# EAGLE design Belajar Eagle (EAGLE 9.6.1)
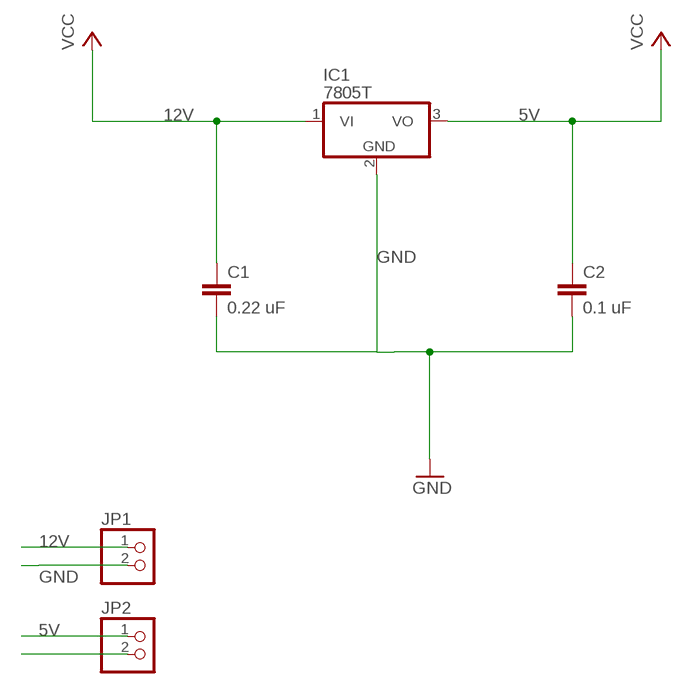
[diagram p0: schematic, sheet 1]

## Parts
C1  0.22 uF  C-EU050-075X075  [C050-075X075]
C2  0.1 uF  C-EU050-075X075  [C050-075X075]
IC1  7805T  [TO220H]
JP1  PINHD-1X2  [1X02]
JP2  PINHD-1X2  [1X02]

## Nets
5V: C2.1 IC1.3(VO) JP2.1 ; supply symbol labelled VCC
12V: C1.1 IC1.1(VI) JP1.1 ; supply symbol labelled VCC
GND: C1.2 C2.2 IC1.2(GND) JP1.2 JP2.2

## Library data of the parts
C1 C2 = rcl:C-EU: CAPACITOR, European symbol; SPICEPREFIX: C
IC1 = linear:78*: Positive VOLTAGE REGULATOR Source: http://cache.national.com/ds/LM/LM78L05.pdf http://www.fairchildsemi.com/ds/LM/LM7805.pdf
JP1 JP2 = pinhead:PINHD-1X2: PIN HEADER

## Board
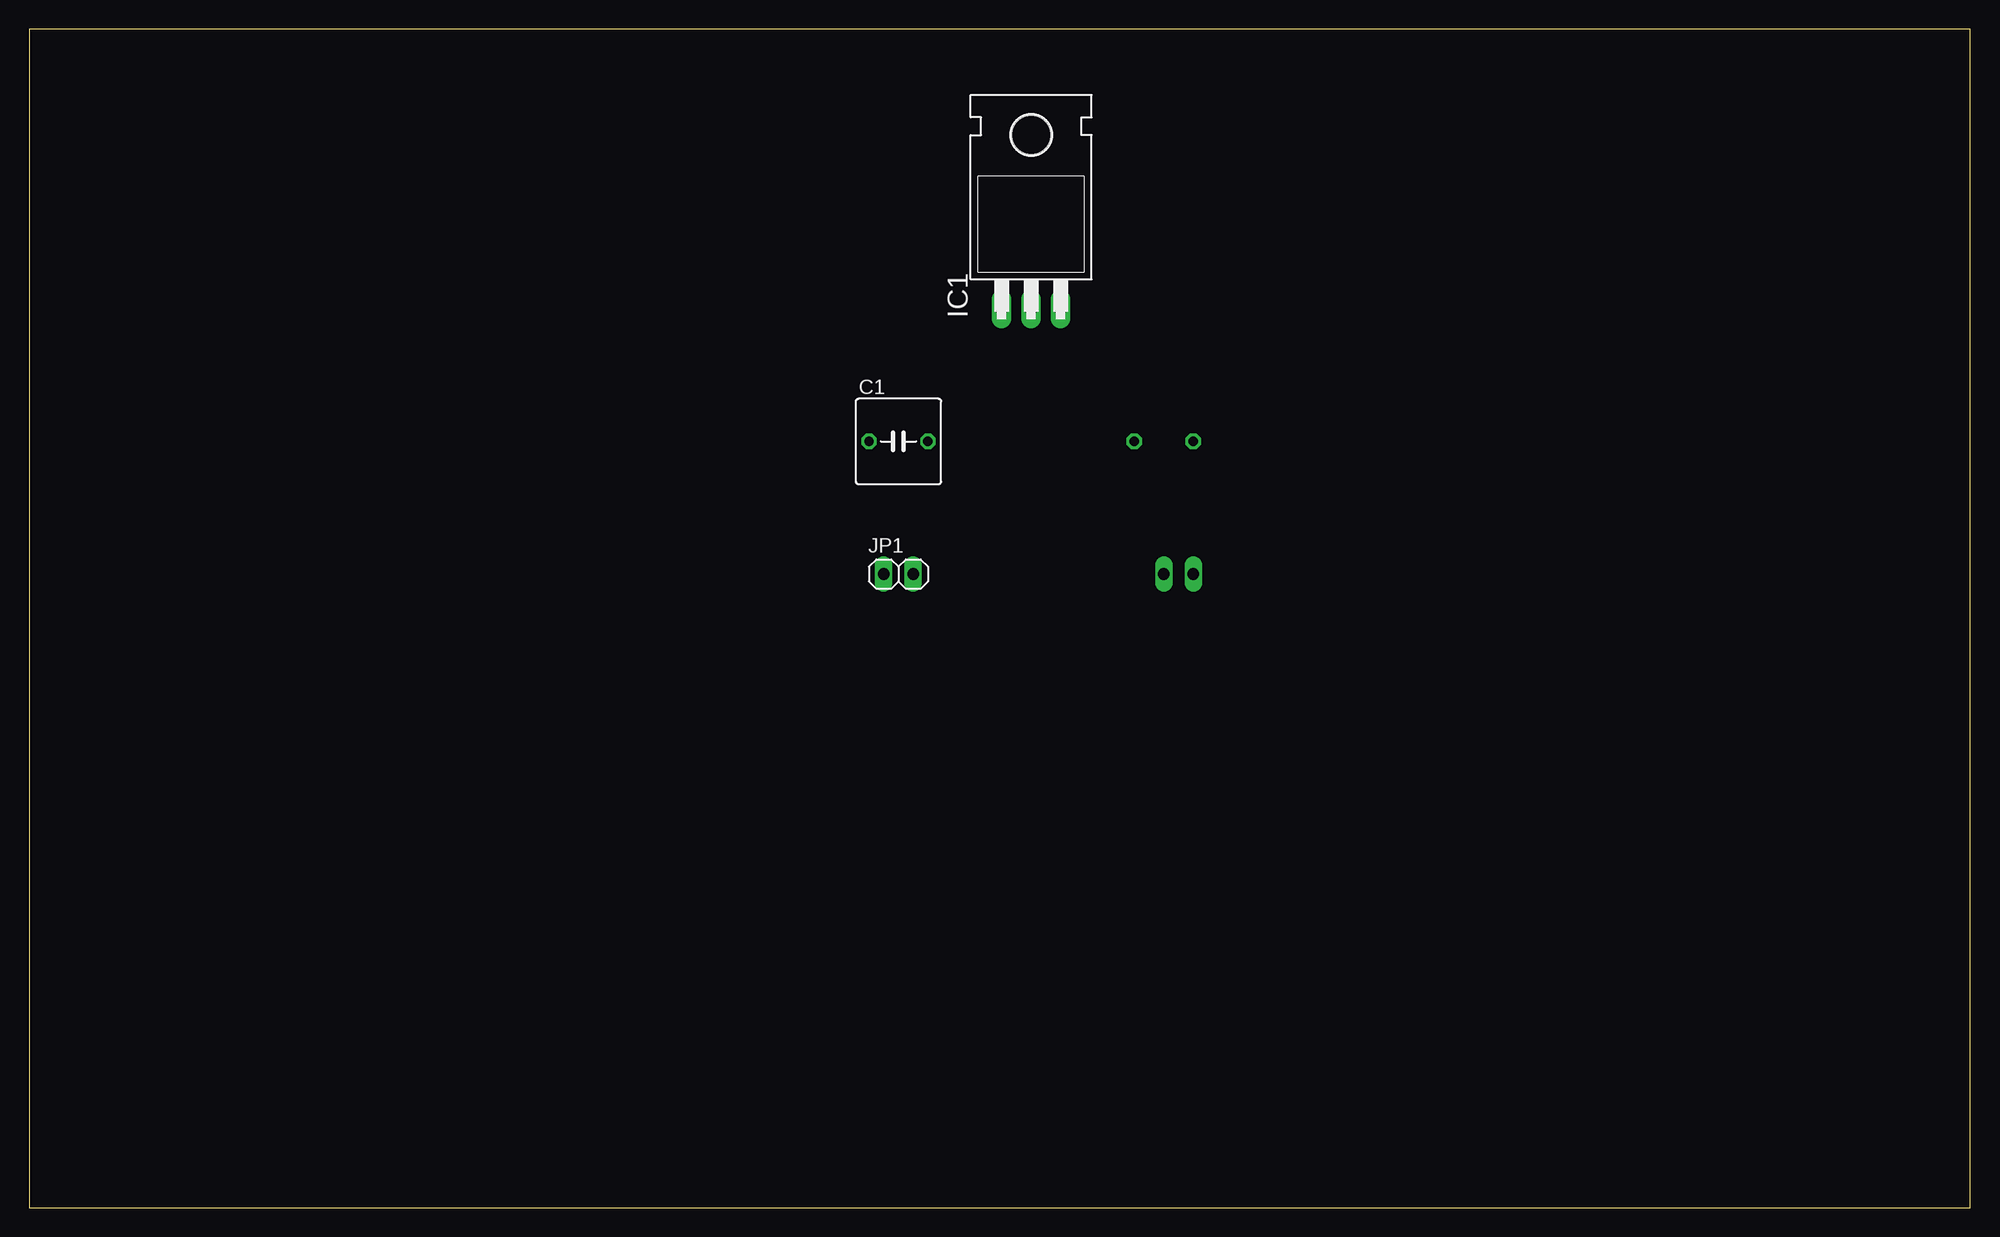
[diagram p1: board, top side]
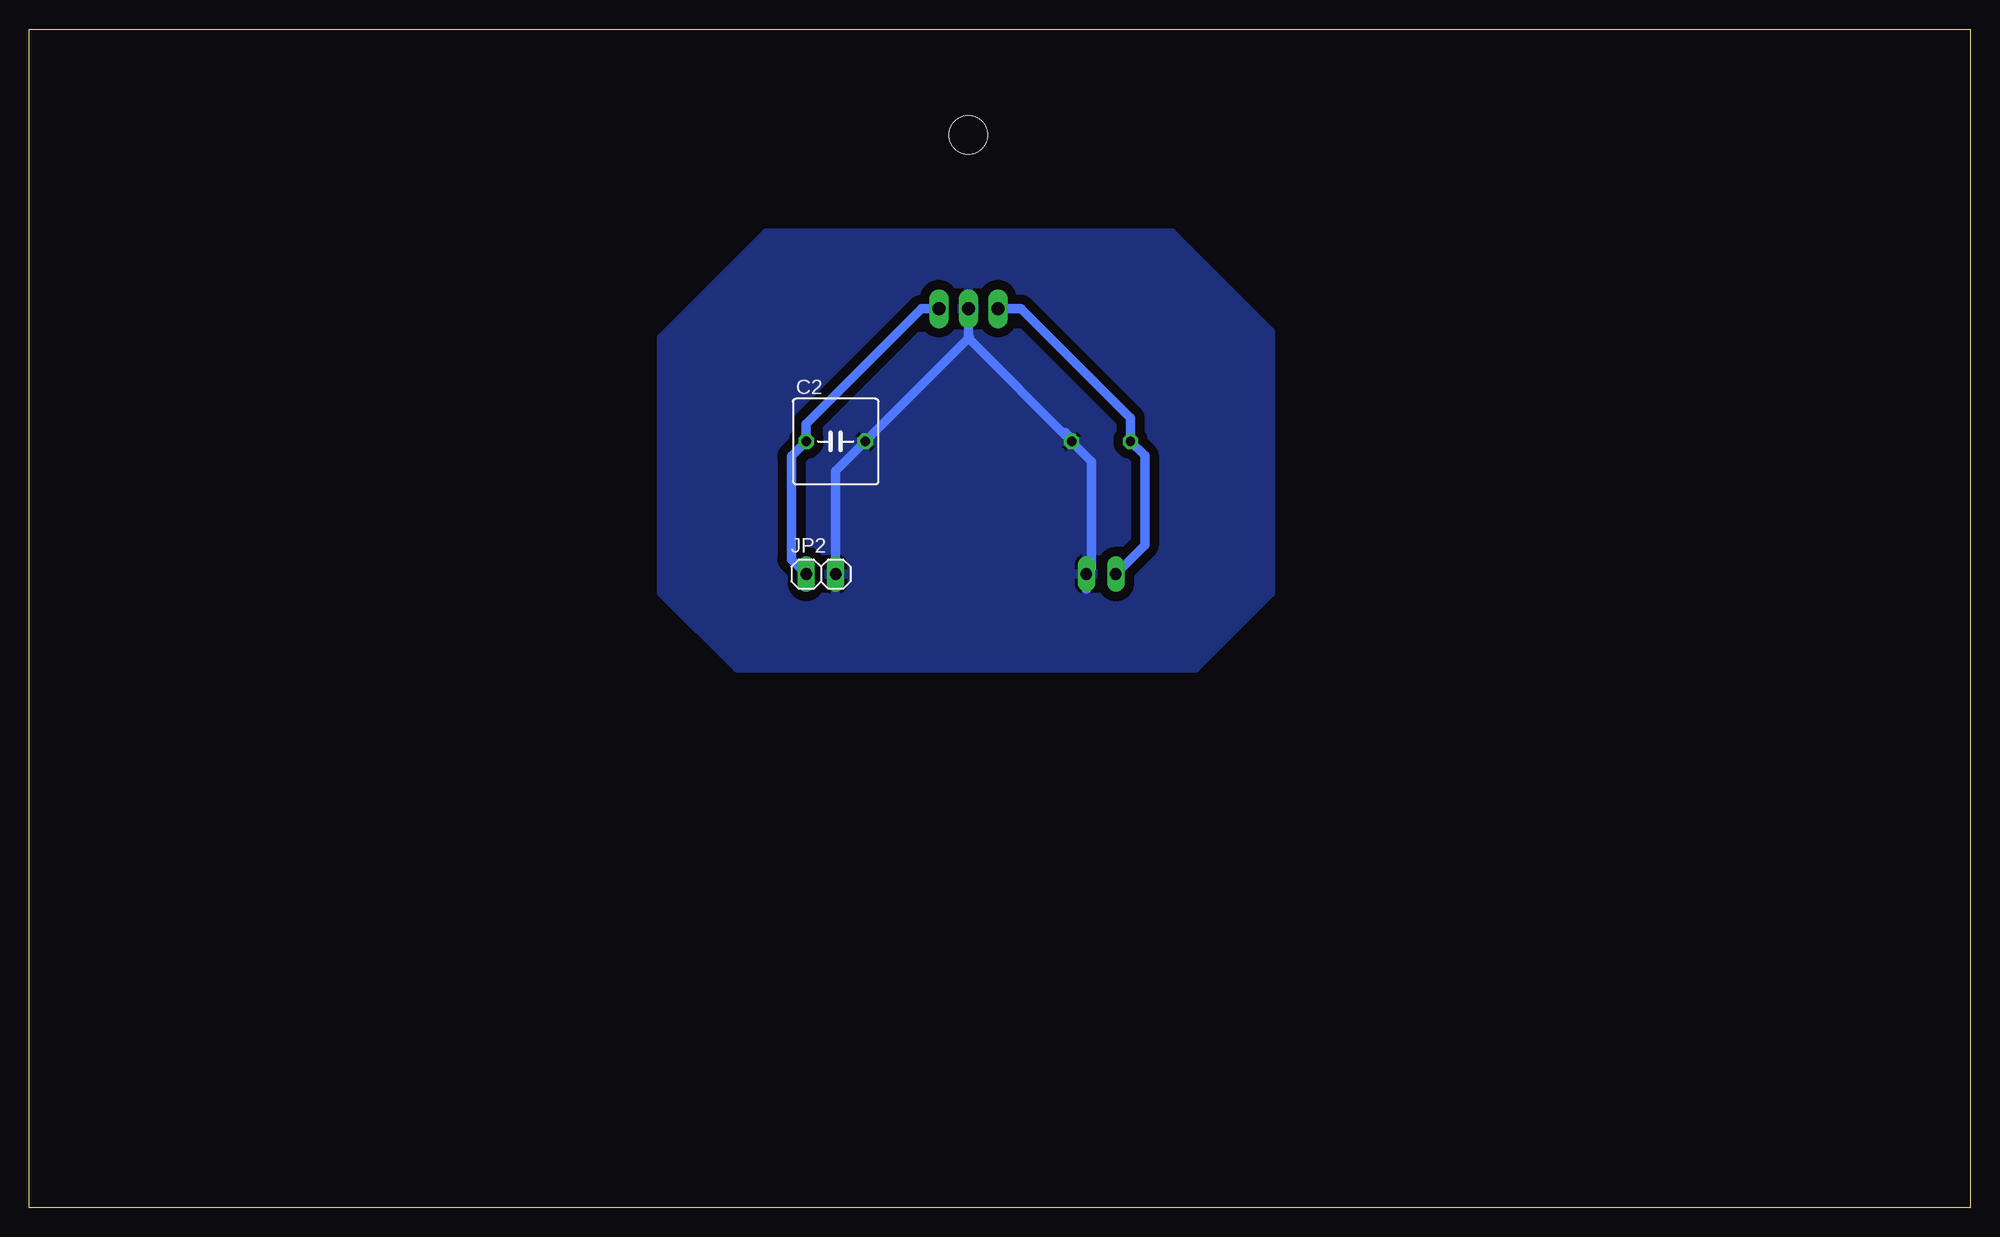
[diagram p2: board, bottom side, seen from below]

Size 167.31 x 101.59 mm. Coordinates in mm from the lower left corner, seen from the top.
Outline: 0,0 167.31,0 167.31,101.59 0,101.59 0,0
Copper layers (1*16): Top 0.035mm / dielectric 1.5mm / Bottom 0.035mm
Design rules "default": minimum track width 6mil, minimum drill 0.35mm, track to track 6mil, track to pad 6mil, pad to pad 6mil, via to via 6mil, smd to smd 6mil, copper to edge 40mil, drill to drill 6mil, minimum pad ring 10mil, minimum via ring 8mil, stop-mask expansion 4mil, vias tented up to drill 0mil, thermal gap 10mil

### Footprints (pad centres in the part's own frame; a part is rotated, then mirrored left to right if it is on the bottom)
C050-075X075 = drill 0.813 octagon: 1 -2.54,0; 2 2.54,0
TO220H = drill 1.118 long: 1 -2.54,-10.16; 2 0,-10.16; 3 2.54,-10.16 | hole 3.302: 0,4.826
1X02 = drill 1.016 long: 1 -1.27,0; 2 1.27,0

### Placement (x,y rotation side)
C1  74.93,66.04 0 top
C2  97.79,66.04 0 bottom
IC1  86.36,87.63 0 top
JP1  74.93,54.61 0 top
JP2  99.06,54.61 0 bottom

### Tracks (layer width: path | path; a pad name or v marks a point on that pad's centre or on a via)
5V
  Bottom 0.8: IC1.3 90.4,77.47 100.33,67.54 C2.1 101.6,64.77 101.6,55.88 JP2.1
12V
  Bottom 0.8: IC1.1 81.82,77.47 72.39,68.04 C1.1 71.16,64.81 71.16,57.11 JP1.1
GND
  Bottom 0.8: C1.2 86.36,74.93 86.36,75.04 | C1.2 78.01,66.58 78.01,66.81 77.36,66.16 C1.2 | 86.24,77.35 IC1.2 86.36,75.04 | JP2.2 97.79,63.5 C2.2 86.25,75.04 86.36,75.04 | C1.2 75.74,64.31 75.74,55.07 JP1.2 76.2,53.34
  pour Bottom (isolate 0.8): 68.81,84 103.81,84 112.81,75 112.81,53 106.31,46.5 66.81,46.5 60.31,53 60.31,54 60.31,75.5